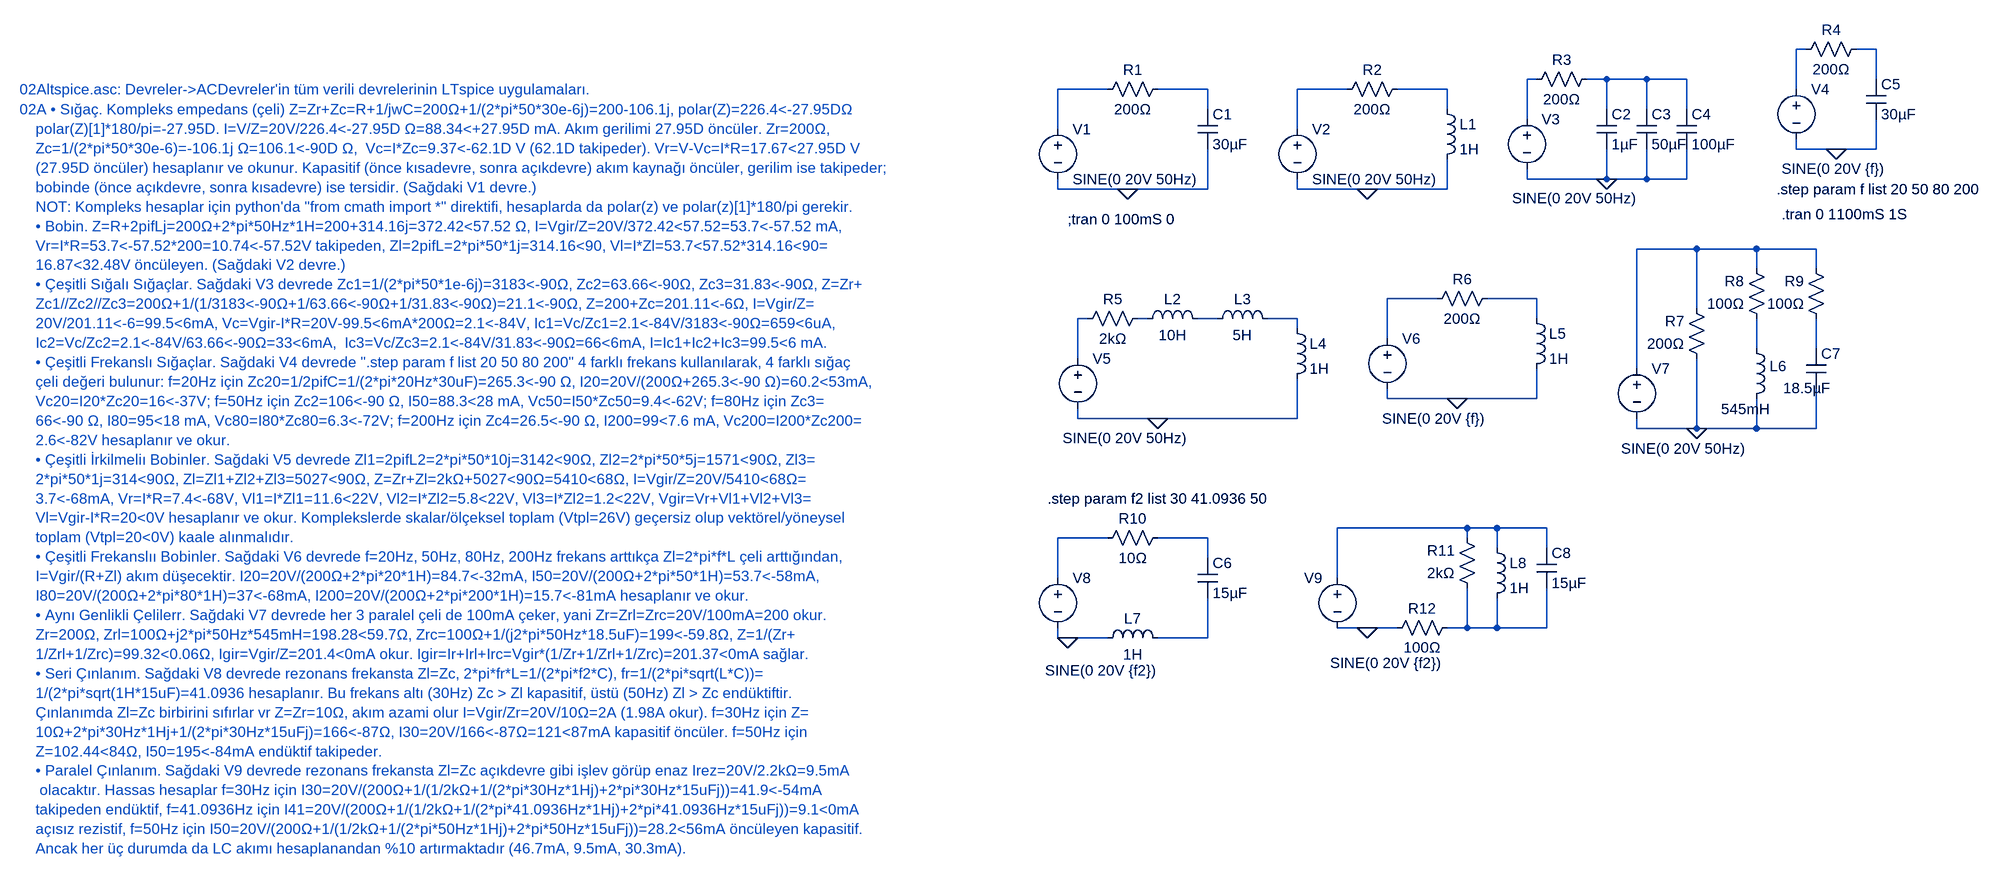
[diagram p0: schematic 02Altspice.asc]
02Altspice.asc, the LTspice schematic file:
Version 4
SHEET 1 2528 1760
WIRE 2080 -16 2064 -16
WIRE 2192 -16 2160 -16
WIRE 1648 32 1632 32
WIRE 1760 32 1728 32
WIRE 1824 32 1760 32
WIRE 1888 32 1824 32
WIRE 2192 32 2192 -16
WIRE 960 48 880 48
WIRE 1120 48 1040 48
WIRE 1344 48 1264 48
WIRE 1504 48 1424 48
WIRE 2064 48 2064 -16
WIRE 1120 80 1120 48
WIRE 1504 80 1504 48
WIRE 1760 80 1760 32
WIRE 1824 80 1824 32
WIRE 1888 80 1888 32
WIRE 1632 96 1632 32
WIRE 880 112 880 48
WIRE 1264 112 1264 48
WIRE 2064 144 2064 128
WIRE 2128 144 2064 144
WIRE 2192 144 2192 96
WIRE 2192 144 2128 144
WIRE 1632 192 1632 176
WIRE 1760 192 1760 144
WIRE 1760 192 1632 192
WIRE 1824 192 1824 144
WIRE 1824 192 1760 192
WIRE 1888 192 1888 144
WIRE 1888 192 1824 192
WIRE 880 208 880 192
WIRE 992 208 880 208
WIRE 1120 208 1120 144
WIRE 1120 208 992 208
WIRE 1264 208 1264 192
WIRE 1376 208 1264 208
WIRE 1504 208 1504 160
WIRE 1504 208 1376 208
WIRE 1904 304 1808 304
WIRE 2000 304 1904 304
WIRE 2096 304 2000 304
WIRE 2000 336 2000 304
WIRE 2096 336 2096 304
WIRE 1488 384 1408 384
WIRE 1648 384 1568 384
WIRE 1904 400 1904 304
WIRE 928 416 912 416
WIRE 1024 416 1008 416
WIRE 1136 416 1104 416
WIRE 1264 416 1216 416
WIRE 1648 416 1648 384
WIRE 1264 432 1264 416
WIRE 1408 448 1408 384
WIRE 2000 464 2000 416
WIRE 2096 464 2096 416
WIRE 912 480 912 416
WIRE 1808 496 1808 304
WIRE 1408 544 1408 528
WIRE 1520 544 1408 544
WIRE 1648 544 1648 496
WIRE 1648 544 1520 544
WIRE 912 576 912 560
WIRE 1040 576 912 576
WIRE 1264 576 1264 512
WIRE 1264 576 1040 576
WIRE 1808 592 1808 576
WIRE 1904 592 1904 480
WIRE 1904 592 1808 592
WIRE 2000 592 2000 544
WIRE 2000 592 1904 592
WIRE 2096 592 2096 528
WIRE 2096 592 2000 592
WIRE 1536 752 1328 752
WIRE 1584 752 1536 752
WIRE 1664 752 1584 752
WIRE 960 768 880 768
WIRE 1120 768 1040 768
WIRE 1536 768 1536 752
WIRE 1584 784 1584 752
WIRE 1664 784 1664 752
WIRE 1120 800 1120 768
WIRE 880 832 880 768
WIRE 1328 832 1328 752
WIRE 1376 912 1328 912
WIRE 1424 912 1376 912
WIRE 1536 912 1536 848
WIRE 1536 912 1504 912
WIRE 1584 912 1584 864
WIRE 1584 912 1536 912
WIRE 1664 912 1664 848
WIRE 1664 912 1584 912
WIRE 880 928 880 912
WIRE 896 928 880 928
WIRE 960 928 896 928
WIRE 1120 928 1120 864
WIRE 1120 928 1040 928
FLAG 992 208 0
FLAG 1376 208 0
FLAG 1760 192 0
FLAG 2128 144 0
FLAG 1040 576 0
FLAG 1520 544 0
FLAG 1904 592 0
FLAG 896 928 0
FLAG 1376 912 0
SYMBOL res 1056 32 R90
WINDOW 3 32 56 VTop 2
WINDOW 0 0 56 VBottom 2
SYMATTR Value 200Ω
SYMATTR InstName R1
SYMBOL voltage 880 96 R0
WINDOW 123 0 0 Left 0
WINDOW 39 0 0 Left 0
SYMATTR InstName V1
SYMATTR Value SINE(0 20V 50Hz)
SYMBOL cap 1104 80 R0
SYMATTR InstName C1
SYMATTR Value 30µF
SYMBOL res 1440 32 R90
WINDOW 3 32 56 VTop 2
WINDOW 0 0 56 VBottom 2
SYMATTR Value 200Ω
SYMATTR InstName R2
SYMBOL voltage 1264 96 R0
WINDOW 123 0 0 Left 0
WINDOW 39 0 0 Left 0
SYMATTR InstName V2
SYMATTR Value SINE(0 20V 50Hz)
SYMBOL ind 1488 64 R0
SYMATTR InstName L1
SYMATTR Value 1H
SYMBOL res 1744 16 R90
WINDOW 3 32 56 VTop 2
WINDOW 0 0 56 VBottom 2
SYMATTR Value 200Ω
SYMATTR InstName R3
SYMBOL voltage 1632 80 R0
WINDOW 123 0 0 Left 0
WINDOW 39 0 0 Left 0
WINDOW 3 -24 143 Left 2
SYMATTR Value SINE(0 20V 50Hz)
SYMATTR InstName V3
SYMBOL cap 1744 80 R0
SYMATTR InstName C2
SYMATTR Value 1µF
SYMBOL cap 1808 80 R0
SYMATTR InstName C3
SYMATTR Value 50µF
SYMBOL cap 1872 80 R0
SYMATTR InstName C4
SYMATTR Value 100µF
SYMBOL res 2176 -32 R90
WINDOW 3 32 56 VTop 2
WINDOW 0 0 56 VBottom 2
SYMATTR Value 200Ω
SYMATTR InstName R4
SYMBOL voltage 2064 32 R0
WINDOW 123 0 0 Left 0
WINDOW 39 0 0 Left 0
WINDOW 3 -24 143 Left 2
SYMATTR Value SINE(0 20V {f})
SYMATTR InstName V4
SYMBOL cap 2176 32 R0
SYMATTR InstName C5
SYMATTR Value 30µF
SYMBOL res 1024 400 R90
WINDOW 3 32 56 VTop 2
WINDOW 0 0 56 VBottom 2
SYMATTR Value 2kΩ
SYMATTR InstName R5
SYMBOL voltage 912 464 R0
WINDOW 123 0 0 Left 0
WINDOW 39 0 0 Left 0
WINDOW 3 -24 143 Left 2
SYMATTR Value SINE(0 20V 50Hz)
SYMATTR InstName V5
SYMBOL ind 1008 432 R270
WINDOW 0 32 56 VTop 2
WINDOW 3 5 56 VBottom 2
SYMATTR InstName L2
SYMATTR Value 10H
SYMBOL ind 1120 432 R270
WINDOW 0 32 56 VTop 2
WINDOW 3 5 56 VBottom 2
SYMATTR InstName L3
SYMATTR Value 5H
SYMBOL ind 1248 416 R0
SYMATTR InstName L4
SYMATTR Value 1H
SYMBOL res 1584 368 R90
WINDOW 3 32 56 VTop 2
WINDOW 0 0 56 VBottom 2
SYMATTR Value 200Ω
SYMATTR InstName R6
SYMBOL voltage 1408 432 R0
WINDOW 123 0 0 Left 0
WINDOW 39 0 0 Left 0
WINDOW 3 -8 144 Left 2
SYMATTR Value SINE(0 20V {f})
SYMATTR InstName V6
SYMBOL ind 1632 400 R0
SYMATTR InstName L5
SYMATTR Value 1H
SYMBOL res 1920 496 R180
WINDOW 3 36 40 Left 2
WINDOW 0 36 76 Left 2
SYMATTR Value 200Ω
SYMATTR InstName R7
SYMBOL voltage 1808 480 R0
WINDOW 123 0 0 Left 0
WINDOW 39 0 0 Left 0
WINDOW 3 -25 144 Left 2
SYMATTR Value SINE(0 20V 50Hz)
SYMATTR InstName V7
SYMBOL cap 2080 464 R0
WINDOW 3 -37 63 Left 2
SYMATTR Value 18.5µF
SYMATTR InstName C7
SYMBOL res 2016 432 R180
WINDOW 3 36 40 Left 2
WINDOW 0 36 76 Left 2
SYMATTR Value 100Ω
SYMATTR InstName R8
SYMBOL ind 1984 448 R0
WINDOW 0 37 44 Left 2
WINDOW 3 -41 113 Left 2
SYMATTR InstName L6
SYMATTR Value 545mH
SYMBOL res 2112 432 R180
WINDOW 3 36 40 Left 2
WINDOW 0 36 76 Left 2
SYMATTR Value 100Ω
SYMATTR InstName R9
SYMBOL res 1056 752 R90
WINDOW 3 32 56 VTop 2
WINDOW 0 0 56 VBottom 2
SYMATTR Value 10Ω
SYMATTR InstName R10
SYMBOL voltage 880 816 R0
WINDOW 123 0 0 Left 0
WINDOW 39 0 0 Left 0
WINDOW 3 -20 164 Left 2
SYMATTR Value SINE(0 20V {f2})
SYMATTR InstName V8
SYMBOL ind 944 944 R270
WINDOW 0 32 56 VTop 2
WINDOW 3 5 56 VBottom 2
SYMATTR InstName L7
SYMATTR Value 1H
SYMBOL cap 1104 800 R0
SYMATTR Value 15µF
SYMATTR InstName C6
SYMBOL res 1552 864 R180
WINDOW 3 36 40 Left 2
WINDOW 0 36 76 Left 2
SYMATTR Value 2kΩ
SYMATTR InstName R11
SYMBOL voltage 1328 816 M0
WINDOW 123 0 0 Left 0
WINDOW 39 0 0 Left 0
WINDOW 3 -167 152 Left 2
SYMATTR Value SINE(0 20V {f2})
SYMATTR InstName V9
SYMBOL ind 1568 768 R0
SYMATTR InstName L8
SYMATTR Value 1H
SYMBOL cap 1648 784 R0
SYMATTR Value 15µF
SYMATTR InstName C8
SYMBOL res 1520 896 R90
WINDOW 3 32 56 VTop 2
WINDOW 0 0 56 VBottom 2
SYMATTR Value 100Ω
SYMATTR InstName R12
TEXT 896 256 Left 2 !;tran 0 100mS 0
TEXT -784 48 Left 2 ;02Altspice.asc: Devreler->ACDevreler'in tüm verili devrelerinin LTspice uygulamaları.
TEXT -784 80 Left 2 ;02A • Sığaç. Kompleks empedans (çeli) Z=Zr+Zc=R+1/jwC=200Ω+1/(2*pi*50*30e-6j)=200-106.1j, polar(Z)=226.4<-27.95DΩ\n    polar(Z)[1]*180/pi=-27.95D. I=V/Z=20V/226.4<-27.95D Ω=88.34<+27.95D mA. Akım gerilimi 27.95D öncüler. Zr=200Ω,\n    Zc=1/(2*pi*50*30e-6)=-106.1j Ω=106.1<-90D Ω,  Vc=I*Zc=9.37<-62.1D V (62.1D takipeder). Vr=V-Vc=I*R=17.67<27.95D V \n    (27.95D öncüler) hesaplanır ve okunur. Kapasitif (önce kısadevre, sonra açıkdevre) akım kaynağı öncüler, gerilim ise takipeder; \n    bobinde (önce açıkdevre, sonra kısadevre) ise tersidir. (Sağdaki V1 devre.)\n    NOT: Kompleks hesaplar için python'da "from cmath import *" direktifi, hesaplarda da polar(z) ve polar(z)[1]*180/pi gerekir.\n    • Bobin. Z=R+2pifLj=200Ω+2*pi*50Hz*1H=200+314.16j=372.42<57.52 Ω, I=Vgir/Z=20V/372.42<57.52=53.7<-57.52 mA,\n    Vr=I*R=53.7<-57.52*200=10.74<-57.52V takipeden, Zl=2pifL=2*pi*50*1j=314.16<90, Vl=I*Zl=53.7<57.52*314.16<90=\n    16.87<32.48V öncüleyen. (Sağdaki V2 devre.)\n    • Çeşitli Sığalı Sığaçlar. Sağdaki V3 devrede Zc1=1/(2*pi*50*1e-6j)=3183<-90Ω, Zc2=63.66<-90Ω, Zc3=31.83<-90Ω, Z=Zr+\n    Zc1//Zc2//Zc3=200Ω+1/(1/3183<-90Ω+1/63.66<-90Ω+1/31.83<-90Ω)=21.1<-90Ω, Z=200+Zc=201.11<-6Ω, I=Vgir/Z=\n    20V/201.11<-6=99.5<6mA, Vc=Vgir-I*R=20V-99.5<6mA*200Ω=2.1<-84V, Ic1=Vc/Zc1=2.1<-84V/3183<-90Ω=659<6uA,\n    Ic2=Vc/Zc2=2.1<-84V/63.66<-90Ω=33<6mA,  Ic3=Vc/Zc3=2.1<-84V/31.83<-90Ω=66<6mA, I=Ic1+Ic2+Ic3=99.5<6 mA.\n    • Çeşitli Frekanslı Sığaçlar. Sağdaki V4 devrede ".step param f list 20 50 80 200" 4 farklı frekans kullanılarak, 4 farklı sığaç\n    çeli değeri bulunur: f=20Hz için Zc20=1/2pifC=1/(2*pi*20Hz*30uF)=265.3<-90 Ω, I20=20V/(200Ω+265.3<-90 Ω)=60.2<53mA,\n    Vc20=I20*Zc20=16<-37V; f=50Hz için Zc2=106<-90 Ω, I50=88.3<28 mA, Vc50=I50*Zc50=9.4<-62V; f=80Hz için Zc3=\n    66<-90 Ω, I80=95<18 mA, Vc80=I80*Zc80=6.3<-72V; f=200Hz için Zc4=26.5<-90 Ω, I200=99<7.6 mA, Vc200=I200*Zc200=\n    2.6<-82V hesaplanır ve okur.\n    • Çeşitli İrkilmeliı Bobinler. Sağdaki V5 devrede Zl1=2pifL2=2*pi*50*10j=3142<90Ω, Zl2=2*pi*50*5j=1571<90Ω, Zl3=\n    2*pi*50*1j=314<90Ω, Zl=Zl1+Zl2+Zl3=5027<90Ω, Z=Zr+Zl=2kΩ+5027<90Ω=5410<68Ω, I=Vgir/Z=20V/5410<68Ω=\n    3.7<-68mA, Vr=I*R=7.4<-68V, Vl1=I*Zl1=11.6<22V, Vl2=I*Zl2=5.8<22V, Vl3=I*Zl2=1.2<22V, Vgir=Vr+Vl1+Vl2+Vl3=\n    Vl=Vgir-I*R=20<0V hesaplanır ve okur. Komplekslerde skalar/ölçeksel toplam (Vtpl=26V) geçersiz olup vektörel/yöneysel\n    toplam (Vtpl=20<0V) kaale alınmalıdır.\n    • Çeşitli Frekanslıı Bobinler. Sağdaki V6 devrede f=20Hz, 50Hz, 80Hz, 200Hz frekans arttıkça Zl=2*pi*f*L çeli arttığından,\n    I=Vgir/(R+Zl) akım düşecektir. I20=20V/(200Ω+2*pi*20*1H)=84.7<-32mA, I50=20V/(200Ω+2*pi*50*1H)=53.7<-58mA,\n    I80=20V/(200Ω+2*pi*80*1H)=37<-68mA, I200=20V/(200Ω+2*pi*200*1H)=15.7<-81mA hesaplanır ve okur.\n    • Aynı Genlikli Çelilerr. Sağdaki V7 devrede her 3 paralel çeli de 100mA çeker, yani Zr=Zrl=Zrc=20V/100mA=200 okur.\n    Zr=200Ω, Zrl=100Ω+j2*pi*50Hz*545mH=198.28<59.7Ω, Zrc=100Ω+1/(j2*pi*50Hz*18.5uF)=199<-59.8Ω, Z=1/(Zr+\n    1/Zrl+1/Zrc)=99.32<0.06Ω, Igir=Vgir/Z=201.4<0mA okur. Igir=Ir+Irl+Irc=Vgir*(1/Zr+1/Zrl+1/Zrc)=201.37<0mA sağlar.\n    • Seri Çınlanım. Sağdaki V8 devrede rezonans frekansta Zl=Zc, 2*pi*fr*L=1/(2*pi*f2*C), fr=1/(2*pi*sqrt(L*C))=\n    1/(2*pi*sqrt(1H*15uF)=41.0936 hesaplanır. Bu frekans altı (30Hz) Zc > Zl kapasitif, üstü (50Hz) Zl > Zc endüktiftir.\n    Çınlanımda Zl=Zc birbirini sıfırlar vr Z=Zr=10Ω, akım azami olur I=Vgir/Zr=20V/10Ω=2A (1.98A okur). f=30Hz için Z=\n    10Ω+2*pi*30Hz*1Hj+1/(2*pi*30Hz*15uFj)=166<-87Ω, I30=20V/166<-87Ω=121<87mA kapasitif öncüler. f=50Hz için\n    Z=102.44<84Ω, I50=195<-84mA endüktif takipeder.\n    • Paralel Çınlanım. Sağdaki V9 devrede rezonans frekansta Zl=Zc açıkdevre gibi işlev görüp enaz Irez=20V/2.2kΩ=9.5mA\n     olacaktır. Hassas hesaplar f=30Hz için I30=20V/(200Ω+1/(1/2kΩ+1/(2*pi*30Hz*1Hj)+2*pi*30Hz*15uFj))=41.9<-54mA \n    takipeden endüktif, f=41.0936Hz için I41=20V/(200Ω+1/(1/2kΩ+1/(2*pi*41.0936Hz*1Hj)+2*pi*41.0936Hz*15uFj))=9.1<0mA \n    açısız rezistif, f=50Hz için I50=20V/(200Ω+1/(1/2kΩ+1/(2*pi*50Hz*1Hj)+2*pi*50Hz*15uFj))=28.2<56mA öncüleyen kapasitif.\n    Ancak her üç durumda da LC akımı hesaplanandan %10 artırmaktadır (46.7mA, 9.5mA, 30.3mA).
TEXT 2032 208 Left 2 !.step param f list 20 50 80 200
TEXT 2040 248 Left 2 !.tran 0 1100mS 1S
TEXT 864 704 Left 2 !.step param f2 list 30 41.0936 50

The netlist it stands for:
* 02Altspice.asc
R1 N006 N005 200Ω
V1 N005 0 SINE(0 20V 50Hz)
C1 N006 0 30µF
R2 N008 N007 200Ω
V2 N007 0 SINE(0 20V 50Hz)
L1 N008 0 1H
R3 N004 N003 200Ω
V3 N003 0 SINE(0 20V 50Hz)
C2 N004 0 1µF
C3 N004 0 50µF
C4 N004 0 100µF
R4 N002 N001 200Ω
V4 N001 0 SINE(0 20V {f})
C5 N002 0 30µF
R5 N013 N012 2kΩ
V5 N012 0 SINE(0 20V 50Hz)
L2 N013 N014 10H
L3 N014 N015 5H
L4 N015 0 1H
R6 N011 N010 200Ω
V6 N010 0 SINE(0 20V {f})
L5 N011 0 1H
R7 0 N009 200Ω
V7 N009 0 SINE(0 20V 50Hz)
C7 N017 0 18.5µF
R8 N016 N009 100Ω
L6 N016 0 545mH
R9 N017 N009 100Ω
R10 N020 N019 10Ω
V8 N019 0 SINE(0 20V {f2})
L7 0 N022 1H
C6 N020 N022 15µF
R11 N021 N018 2kΩ
V9 N018 0 SINE(0 20V {f2})
L8 N018 N021 1H
C8 N018 N021 15µF
R12 N021 0 100Ω
;tran 0 100mS 0
* 02Altspice.asc: Devreler->ACDevreler'in tüm verili devrelerinin LTspice uygulamaları.
* 02A • Sığaç. Kompleks empedans (çeli) Z=Zr+Zc=R+1/jwC=200Ω+1/(2*pi*50*30e-6j)=200-106.1j, polar(Z)=226.4<-27.95DΩ
*     polar(Z)[1]*180/pi=-27.95D. I=V/Z=20V/226.4<-27.95D Ω=88.34<+27.95D mA. Akım gerilimi 27.95D öncüler. Zr=200Ω,
*     Zc=1/(2*pi*50*30e-6)=-106.1j Ω=106.1<-90D Ω,  Vc=I*Zc=9.37<-62.1D V (62.1D takipeder). Vr=V-Vc=I*R=17.67<27.95D V
*     (27.95D öncüler) hesaplanır ve okunur. Kapasitif (önce kısadevre, sonra açıkdevre) akım kaynağı öncüler, gerilim ise takipeder;
*     bobinde (önce açıkdevre, sonra kısadevre) ise tersidir. (Sağdaki V1 devre.)
*     NOT: Kompleks hesaplar için python'da "from cmath import *" direktifi, hesaplarda da polar(z) ve polar(z)[1]*180/pi gerekir.
*     • Bobin. Z=R+2pifLj=200Ω+2*pi*50Hz*1H=200+314.16j=372.42<57.52 Ω, I=Vgir/Z=20V/372.42<57.52=53.7<-57.52 mA,
*     Vr=I*R=53.7<-57.52*200=10.74<-57.52V takipeden, Zl=2pifL=2*pi*50*1j=314.16<90, Vl=I*Zl=53.7<57.52*314.16<90=
*     16.87<32.48V öncüleyen. (Sağdaki V2 devre.)
*     • Çeşitli Sığalı Sığaçlar. Sağdaki V3 devrede Zc1=1/(2*pi*50*1e-6j)=3183<-90Ω, Zc2=63.66<-90Ω, Zc3=31.83<-90Ω, Z=Zr+
*     Zc1//Zc2//Zc3=200Ω+1/(1/3183<-90Ω+1/63.66<-90Ω+1/31.83<-90Ω)=21.1<-90Ω, Z=200+Zc=201.11<-6Ω, I=Vgir/Z=
*     20V/201.11<-6=99.5<6mA, Vc=Vgir-I*R=20V-99.5<6mA*200Ω=2.1<-84V, Ic1=Vc/Zc1=2.1<-84V/3183<-90Ω=659<6uA,
*     Ic2=Vc/Zc2=2.1<-84V/63.66<-90Ω=33<6mA,  Ic3=Vc/Zc3=2.1<-84V/31.83<-90Ω=66<6mA, I=Ic1+Ic2+Ic3=99.5<6 mA.
*     • Çeşitli Frekanslı Sığaçlar. Sağdaki V4 devrede ".step param f list 20 50 80 200" 4 farklı frekans kullanılarak, 4 farklı sığaç
*     çeli değeri bulunur: f=20Hz için Zc20=1/2pifC=1/(2*pi*20Hz*30uF)=265.3<-90 Ω, I20=20V/(200Ω+265.3<-90 Ω)=60.2<53mA,
*     Vc20=I20*Zc20=16<-37V; f=50Hz için Zc2=106<-90 Ω, I50=88.3<28 mA, Vc50=I50*Zc50=9.4<-62V; f=80Hz için Zc3=
*     66<-90 Ω, I80=95<18 mA, Vc80=I80*Zc80=6.3<-72V; f=200Hz için Zc4=26.5<-90 Ω, I200=99<7.6 mA, Vc200=I200*Zc200=
*     2.6<-82V hesaplanır ve okur.
*     • Çeşitli İrkilmeliı Bobinler. Sağdaki V5 devrede Zl1=2pifL2=2*pi*50*10j=3142<90Ω, Zl2=2*pi*50*5j=1571<90Ω, Zl3=
*     2*pi*50*1j=314<90Ω, Zl=Zl1+Zl2+Zl3=5027<90Ω, Z=Zr+Zl=2kΩ+5027<90Ω=5410<68Ω, I=Vgir/Z=20V/5410<68Ω=
*     3.7<-68mA, Vr=I*R=7.4<-68V, Vl1=I*Zl1=11.6<22V, Vl2=I*Zl2=5.8<22V, Vl3=I*Zl2=1.2<22V, Vgir=Vr+Vl1+Vl2+Vl3=
*     Vl=Vgir-I*R=20<0V hesaplanır ve okur. Komplekslerde skalar/ölçeksel toplam (Vtpl=26V) geçersiz olup vektörel/yöneysel
*     toplam (Vtpl=20<0V) kaale alınmalıdır.
*     • Çeşitli Frekanslıı Bobinler. Sağdaki V6 devrede f=20Hz, 50Hz, 80Hz, 200Hz frekans arttıkça Zl=2*pi*f*L çeli arttığından,
*     I=Vgir/(R+Zl) akım düşecektir. I20=20V/(200Ω+2*pi*20*1H)=84.7<-32mA, I50=20V/(200Ω+2*pi*50*1H)=53.7<-58mA,
*     I80=20V/(200Ω+2*pi*80*1H)=37<-68mA, I200=20V/(200Ω+2*pi*200*1H)=15.7<-81mA hesaplanır ve okur.
*     • Aynı Genlikli Çelilerr. Sağdaki V7 devrede her 3 paralel çeli de 100mA çeker, yani Zr=Zrl=Zrc=20V/100mA=200 okur.
*     Zr=200Ω, Zrl=100Ω+j2*pi*50Hz*545mH=198.28<59.7Ω, Zrc=100Ω+1/(j2*pi*50Hz*18.5uF)=199<-59.8Ω, Z=1/(Zr+
*     1/Zrl+1/Zrc)=99.32<0.06Ω, Igir=Vgir/Z=201.4<0mA okur. Igir=Ir+Irl+Irc=Vgir*(1/Zr+1/Zrl+1/Zrc)=201.37<0mA sağlar.
*     • Seri Çınlanım. Sağdaki V8 devrede rezonans frekansta Zl=Zc, 2*pi*fr*L=1/(2*pi*f2*C), fr=1/(2*pi*sqrt(L*C))=
*     1/(2*pi*sqrt(1H*15uF)=41.0936 hesaplanır. Bu frekans altı (30Hz) Zc > Zl kapasitif, üstü (50Hz) Zl > Zc endüktiftir.
*     Çınlanımda Zl=Zc birbirini sıfırlar vr Z=Zr=10Ω, akım azami olur I=Vgir/Zr=20V/10Ω=2A (1.98A okur). f=30Hz için Z=
*     10Ω+2*pi*30Hz*1Hj+1/(2*pi*30Hz*15uFj)=166<-87Ω, I30=20V/166<-87Ω=121<87mA kapasitif öncüler. f=50Hz için
*     Z=102.44<84Ω, I50=195<-84mA endüktif takipeder.
*     • Paralel Çınlanım. Sağdaki V9 devrede rezonans frekansta Zl=Zc açıkdevre gibi işlev görüp enaz Irez=20V/2.2kΩ=9.5mA
*      olacaktır. Hassas hesaplar f=30Hz için I30=20V/(200Ω+1/(1/2kΩ+1/(2*pi*30Hz*1Hj)+2*pi*30Hz*15uFj))=41.9<-54mA
*     takipeden endüktif, f=41.0936Hz için I41=20V/(200Ω+1/(1/2kΩ+1/(2*pi*41.0936Hz*1Hj)+2*pi*41.0936Hz*15uFj))=9.1<0mA
*     açısız rezistif, f=50Hz için I50=20V/(200Ω+1/(1/2kΩ+1/(2*pi*50Hz*1Hj)+2*pi*50Hz*15uFj))=28.2<56mA öncüleyen kapasitif.
*     Ancak her üç durumda da LC akımı hesaplanandan %10 artırmaktadır (46.7mA, 9.5mA, 30.3mA).
.step param f list 20 50 80 200
.tran 0 1100mS 1S
.step param f2 list 30 41.0936 50
.backanno
.end